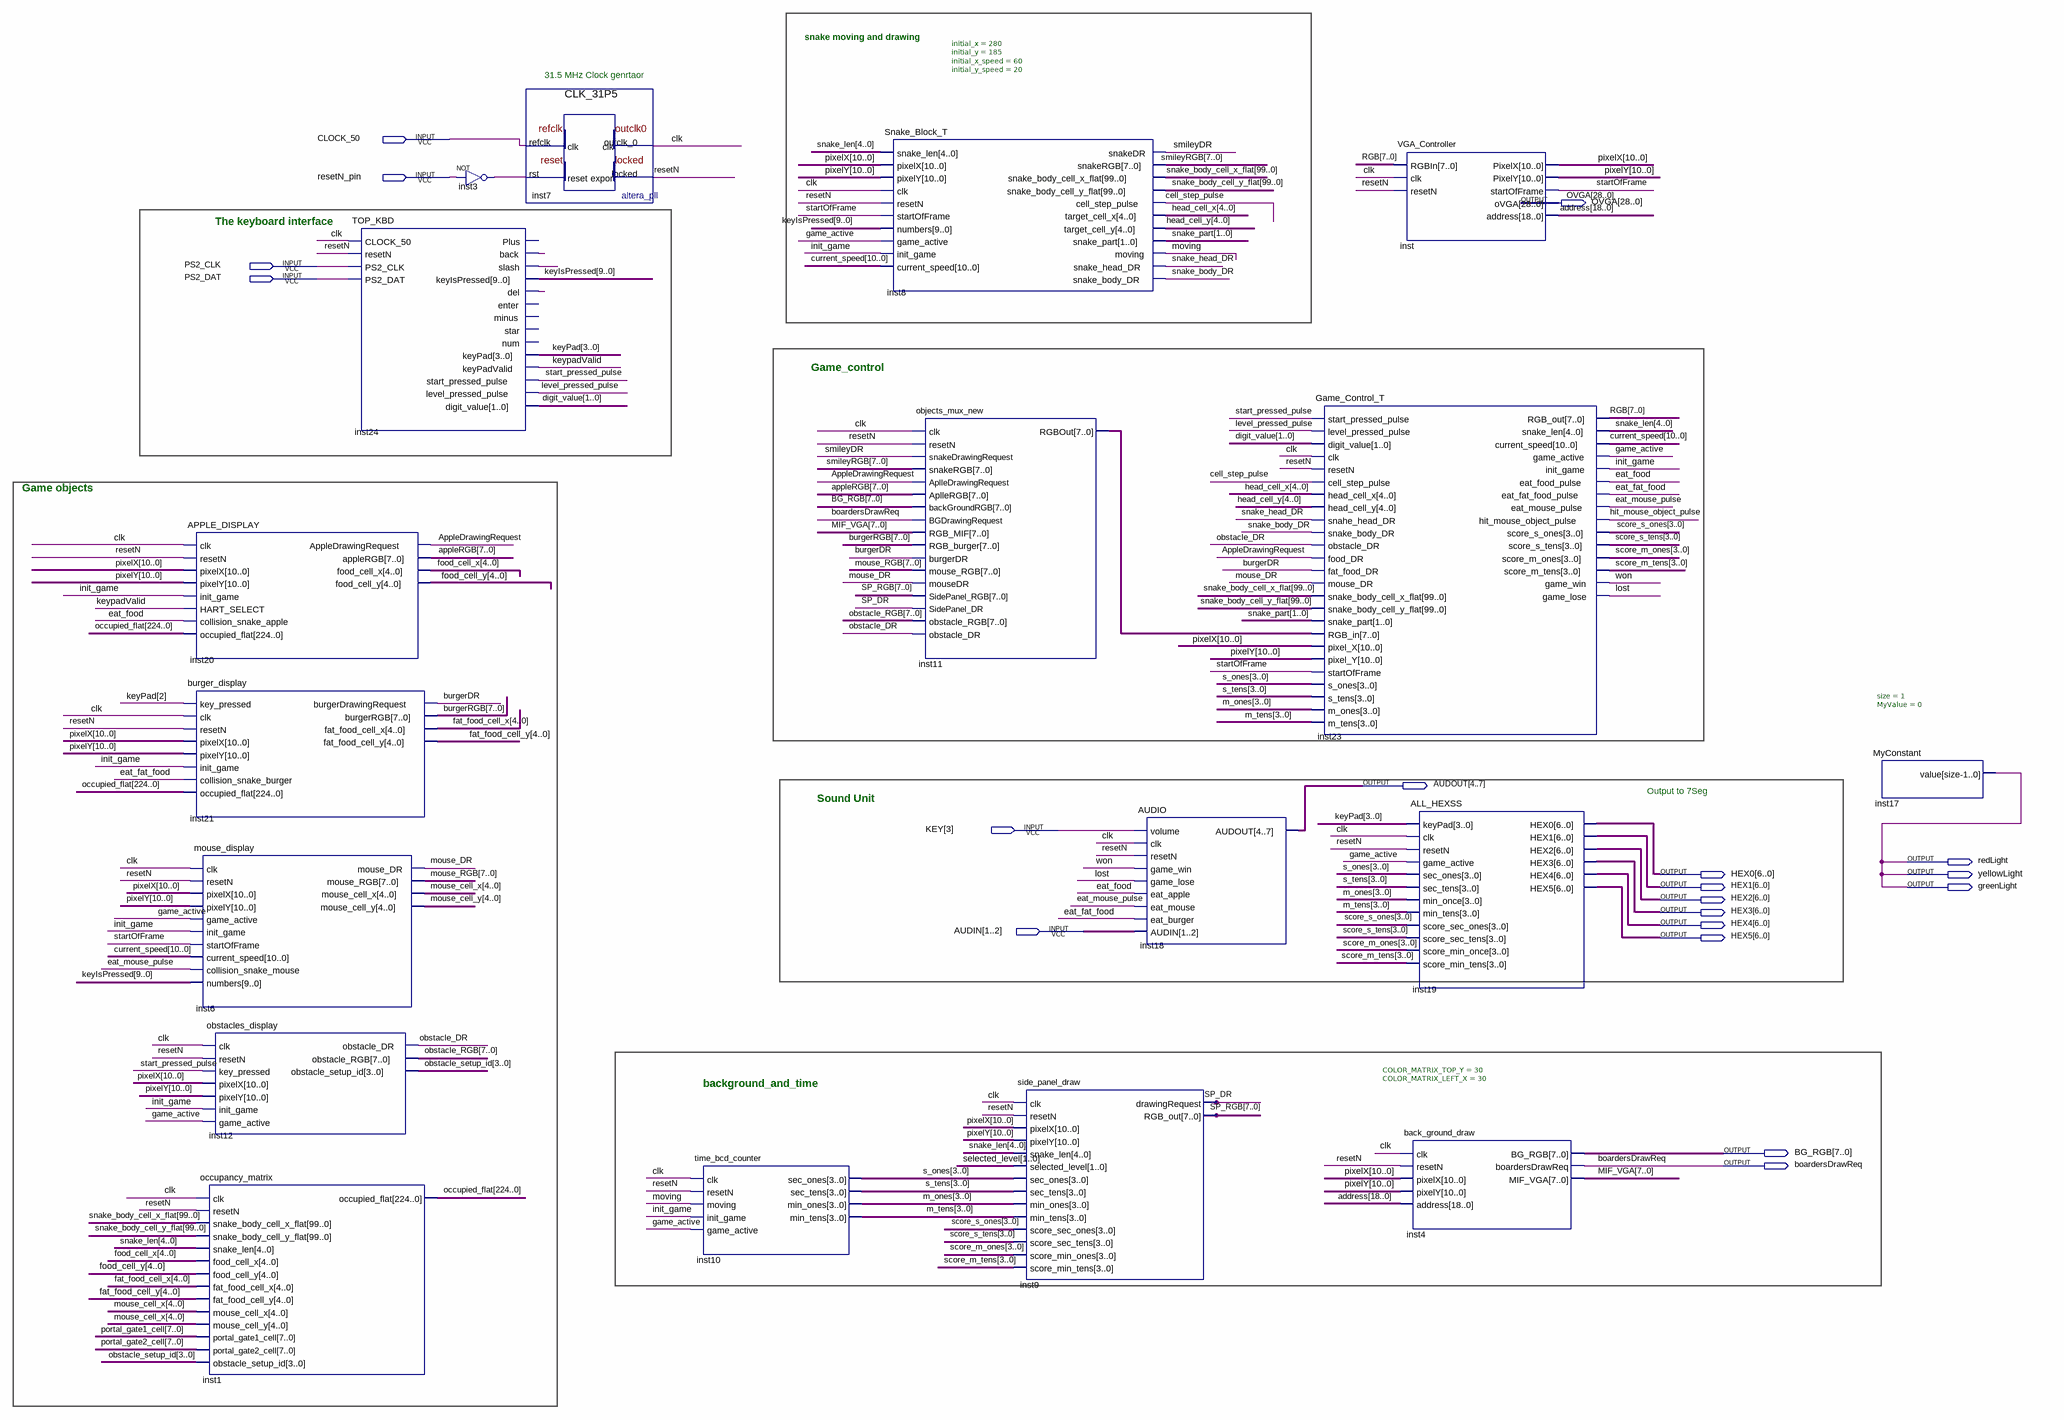
[diagram p0: schematic sheet]
// Quartus schematic TOP_VGA_DEMO_project1.bdf as structural Verilog: 18 symbols, 19 pins
module TOP_VGA_DEMO_project1 (
  input  CLOCK_50,
  input  resetN_pin,
  input  PS2_CLK,
  input  PS2_DAT,
  input  [3:3] KEY,
  input  [1:2] AUDIN,
  output [28:0] OVGA,
  output [4:7] AUDOUT,
  output redLight,
  output [6:0] HEX0,
  output yellowLight,
  output [6:0] HEX1,
  output greenLight,
  output [6:0] HEX2,
  output [6:0] HEX3,
  output [6:0] HEX4,
  output [6:0] HEX5,
  output [7:0] BG_RGB,
  output boardersDrawReq
);

  wire AppleDrawingRequest, burgerDR, cell_step_pulse, clk, eat_fat_food, eat_food, eat_mouse_pulse,
       game_active, hit_mouse_object_pulse, init_game, inst3_out, inst24_back, inst24_del, inst24_slash,
       keypadValid, level_pressed_pulse, lost, mouse_DR, moving, obstacle_DR, resetN, smileyDR,
       snake_body_DR, snake_head_DR, SP_DR, start_pressed_pulse, startOfFrame, won;
  wire [1:0] digit_value, selected_level, snake_part;
  wire [3:0] keyPad, m_ones, m_tens, obstacle_setup_id, s_ones, s_tens, score_m_ones, score_m_tens,
       score_s_ones, score_s_tens;
  wire [4:0] fat_food_cell_x, fat_food_cell_y, food_cell_x, food_cell_y, head_cell_x, head_cell_y,
       mouse_cell_x, mouse_cell_y, snake_len;
  wire [7:0] appleRGB, burgerRGB, inst11_rgbout, MIF_VGA, mouse_RGB, obstacle_RGB, portal_gate1_cell,
       portal_gate2_cell, RGB, smileyRGB, SP_RGB;
  wire [9:0] keyIsPressed;
  wire [10:0] current_speed, pixelX, pixelY;
  wire [18:0] address;
  wire [99:0] snake_body_cell_x_flat, snake_body_cell_y_flat;
  wire [224:0] occupied_flat;

  APPLE_DISPLAY inst20 (
    .clk(clk), .resetN(resetN), .pixelX(pixelX), .pixelY(pixelY), .init_game(init_game),
    .HART_SELECT(keypadValid), .collision_snake_apple(eat_food), .occupied_flat(occupied_flat),
    .AppleDrawingRequest(AppleDrawingRequest), .appleRGB(appleRGB), .food_cell_x(food_cell_x),
    .food_cell_y(food_cell_y));
  burger_display inst21 (
    .key_pressed(keyPad[2]), .clk(clk), .resetN(resetN), .pixelX(pixelX), .pixelY(pixelY),
    .init_game(init_game), .collision_snake_burger(eat_fat_food), .occupied_flat(occupied_flat),
    .burgerDrawingRequest(burgerDR), .burgerRGB(burgerRGB), .fat_food_cell_x(fat_food_cell_x),
    .fat_food_cell_y(fat_food_cell_y));
  mouse_display inst6 (
    .clk(clk), .resetN(resetN), .pixelX(pixelX), .pixelY(pixelY), .game_active(game_active),
    .init_game(init_game), .startOfFrame(startOfFrame), .current_speed(current_speed),
    .collision_snake_mouse(eat_mouse_pulse), .numbers(keyIsPressed), .mouse_DR(mouse_DR),
    .mouse_RGB(mouse_RGB), .mouse_cell_x(mouse_cell_x), .mouse_cell_y(mouse_cell_y));
  obstacles_display inst12 (
    .clk(clk), .resetN(resetN), .key_pressed(start_pressed_pulse), .pixelX(pixelX), .pixelY(pixelY),
    .init_game(init_game), .game_active(game_active), .obstacle_DR(obstacle_DR), .obstacle_RGB(obstacle_RGB),
    .obstacle_setup_id(obstacle_setup_id));
  occupancy_matrix inst1 (
    .clk(clk), .resetN(resetN), .snake_body_cell_x_flat(snake_body_cell_x_flat),
    .snake_body_cell_y_flat(snake_body_cell_y_flat), .snake_len(snake_len), .food_cell_x(food_cell_x),
    .food_cell_y(food_cell_y), .fat_food_cell_x(fat_food_cell_x), .fat_food_cell_y(fat_food_cell_y),
    .mouse_cell_x(mouse_cell_x), .mouse_cell_y(mouse_cell_x), .portal_gate1_cell(portal_gate1_cell),
    .portal_gate2_cell(portal_gate2_cell), .obstacle_setup_id(obstacle_setup_id),
    .occupied_flat(occupied_flat));
  TOP_KBD inst24 (
    .CLOCK_50(clk), .resetN(resetN), .PS2_CLK(PS2_CLK), .PS2_DAT(PS2_DAT), .back(inst24_back),
    .slash(inst24_slash), .keyIsPressed(keyIsPressed), .del(inst24_del), .keyPad(keyPad),
    .keyPadValid(keypadValid), .start_pressed_pulse(start_pressed_pulse),
    .level_pressed_pulse(level_pressed_pulse), .digit_value(digit_value));  // open: Plus, enter, minus, star, num
  not inst3 (inst3_out, resetN_pin);
  CLK_31P5 inst7 (.refclk(CLOCK_50), .rst(inst3_out), .outclk_0(clk), .locked(resetN));
  time_bcd_counter inst10 (
    .clk(clk), .resetN(resetN), .moving(moving), .init_game(init_game), .game_active(game_active),
    .sec_ones(s_ones), .sec_tens(s_tens), .min_ones(m_ones), .min_tens(m_tens));
  Snake_Block_T #(.initial_x(280), .initial_y(185), .initial_x_speed(60), .initial_y_speed(20)) inst8 (
    .snake_len(snake_len), .pixelX(pixelX), .pixelY(pixelY), .clk(clk), .resetN(resetN),
    .startOfFrame(startOfFrame), .numbers(keyIsPressed), .game_active(game_active), .init_game(init_game),
    .current_speed(current_speed), .snakeDR(smileyDR), .snakeRGB(smileyRGB),
    .snake_body_cell_x_flat(snake_body_cell_x_flat), .snake_body_cell_y_flat(snake_body_cell_y_flat),
    .cell_step_pulse(cell_step_pulse), .target_cell_x(head_cell_x), .target_cell_y(head_cell_y),
    .snake_part(snake_part), .moving(moving), .snake_head_DR(snake_head_DR), .snake_body_DR(snake_body_DR));
  objects_mux_new inst11 (
    .clk(clk), .resetN(resetN), .snakeDrawingRequest(smileyDR), .snakeRGB(smileyRGB),
    .AplleDrawingRequest(AppleDrawingRequest), .AplleRGB(appleRGB), .backGroundRGB(BG_RGB),
    .BGDrawingRequest(boardersDrawReq), .RGB_MIF(MIF_VGA), .RGB_burger(burgerRGB), .burgerDR(burgerDR),
    .mouse_RGB(mouse_RGB), .mouseDR(mouse_DR), .SidePanel_RGB(SP_RGB), .SidePanel_DR(SP_DR),
    .obstacle_RGB(obstacle_RGB), .obstacle_DR(obstacle_DR), .RGBOut(inst11_rgbout));
  side_panel_draw inst9 (
    .clk(clk), .resetN(resetN), .pixelX(pixelX), .pixelY(pixelY), .snake_len(snake_len),
    .selected_level(selected_level), .sec_ones(s_ones), .sec_tens(s_tens), .min_ones(m_ones),
    .min_tens(m_tens), .score_sec_ones(score_s_ones), .score_sec_tens(score_s_tens),
    .score_min_ones(score_m_ones), .score_min_tens(score_m_tens), .drawingRequest(SP_DR), .RGB_out(SP_RGB));
  AUDIO inst18 (
    .volume(KEY[3]), .clk(clk), .resetN(resetN), .game_win(won), .game_lose(lost), .eat_apple(eat_food),
    .eat_mouse(eat_mouse_pulse), .eat_burger(eat_fat_food), .AUDIN(AUDIN), .AUDOUT(AUDOUT));
  Game_Control_T inst23 (
    .start_pressed_pulse(start_pressed_pulse), .level_pressed_pulse(level_pressed_pulse),
    .digit_value(digit_value), .clk(clk), .resetN(resetN), .cell_step_pulse(cell_step_pulse),
    .head_cell_x(head_cell_x), .head_cell_y(head_cell_y), .snahe_head_DR(snake_head_DR),
    .snake_body_DR(snake_body_DR), .obstacle_DR(obstacle_DR), .food_DR(AppleDrawingRequest),
    .fat_food_DR(burgerDR), .mouse_DR(mouse_DR), .snake_body_cell_x_flat(snake_body_cell_x_flat),
    .snake_body_cell_y_flat(snake_body_cell_y_flat), .snake_part(snake_part), .RGB_in(inst11_rgbout),
    .pixel_X(pixelX), .pixel_Y(pixelY), .startOfFrame(startOfFrame), .s_ones(s_ones), .s_tens(s_tens),
    .m_ones(m_ones), .m_tens(m_tens), .RGB_out(RGB), .snake_len(snake_len), .current_speed(current_speed),
    .game_active(game_active), .init_game(init_game), .eat_food_pulse(eat_food),
    .eat_fat_food_pulse(eat_fat_food), .eat_mouse_pulse(eat_mouse_pulse),
    .hit_mouse_object_pulse(hit_mouse_object_pulse), .score_s_ones(score_s_ones),
    .score_s_tens(score_s_tens), .score_m_ones(score_m_ones), .score_m_tens(score_m_tens), .game_win(won),
    .game_lose(lost));
  VGA_Controller inst (
    .RGBIn(RGB), .clk(clk), .resetN(resetN), .PixelX(pixelX), .PixelY(pixelY), .startOfFrame(startOfFrame),
    .oVGA(OVGA), .address(address));
  ALL_HEXSS inst19 (
    .keyPad(keyPad), .clk(clk), .resetN(resetN), .game_active(game_active), .sec_ones(s_ones),
    .sec_tens(s_tens), .min_once(m_ones), .min_tens(m_tens), .score_sec_ones(score_s_ones),
    .score_sec_tens(score_s_tens), .score_min_once(score_m_ones), .score_min_tens(score_m_tens), .HEX0(HEX0),
    .HEX1(HEX1), .HEX2(HEX2), .HEX3(HEX3), .HEX4(HEX4), .HEX5(HEX5));
  back_ground_draw #(.COLOR_MATRIX_TOP_Y(30), .COLOR_MATRIX_LEFT_X(30)) inst4 (
    .clk(clk), .resetN(resetN), .pixelX(pixelX), .pixelY(pixelY), .address(address), .BG_RGB(BG_RGB),
    .boardersDrawReq(boardersDrawReq), .MIF_VGA(MIF_VGA));
  MyConstant #(.size(1), .MyValue(0)) inst17 (.value(greenLight));

  assign redLight = greenLight;
  assign yellowLight = greenLight;

  // Notes on the sheet:
  //   snake moving and drawing
  //   31.5 MHz Clock genrtaor
  //   The keyboard interface
  //   Game_control
  //    Game objects 
  //   Output to 7Seg
  //   Sound Unit
  //   background_and_time
endmodule
